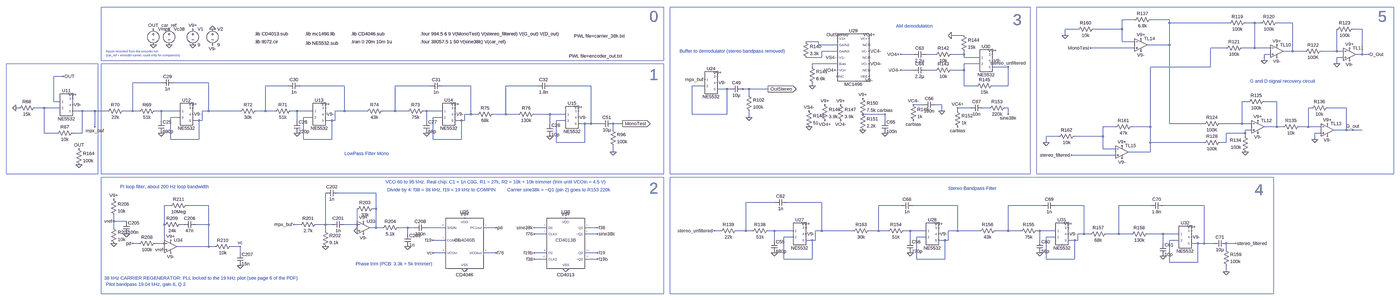
[diagram p0: schematic FM_Decoder.asc, whole sheet]
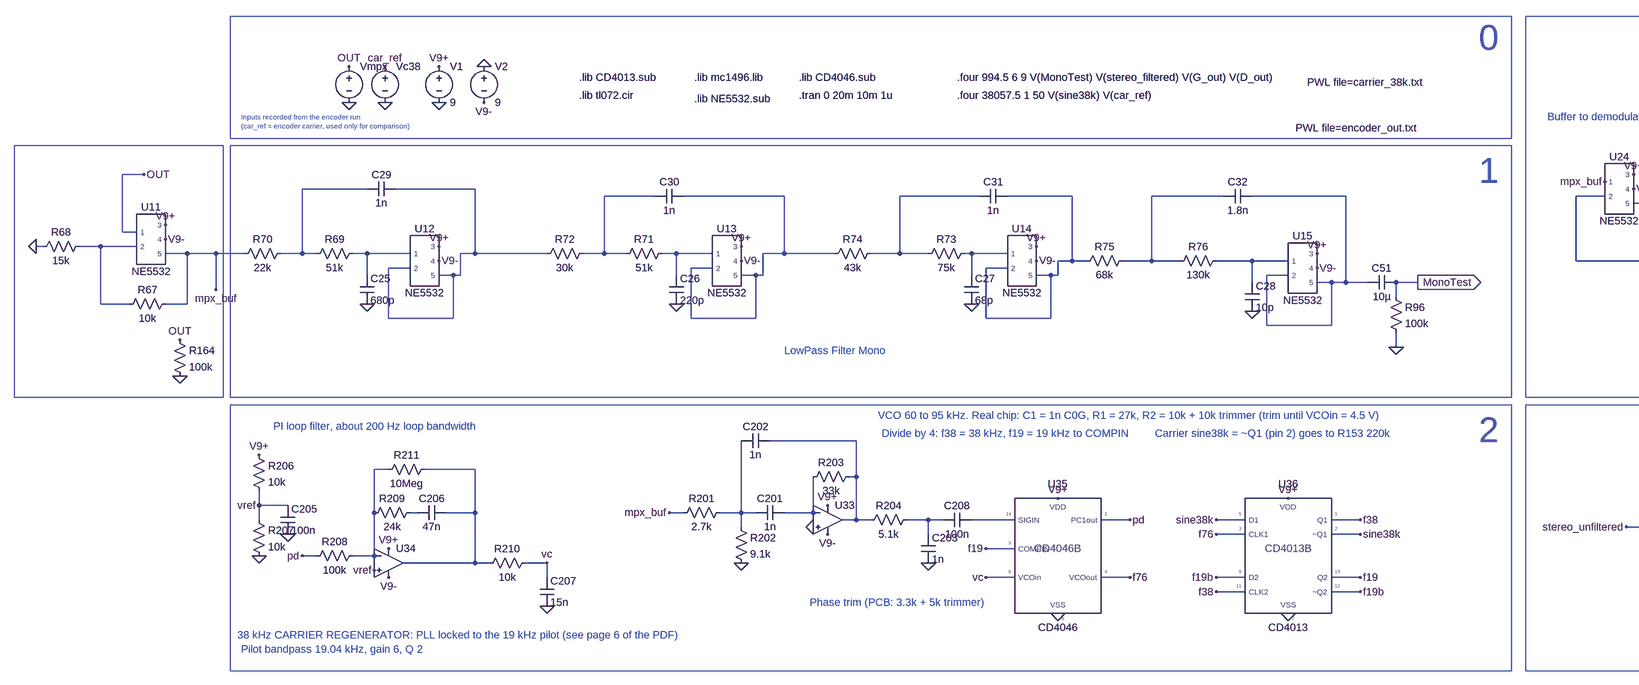
[diagram p1: schematic FM_Decoder.asc, part, row 1 of 1, column 1 of 2]
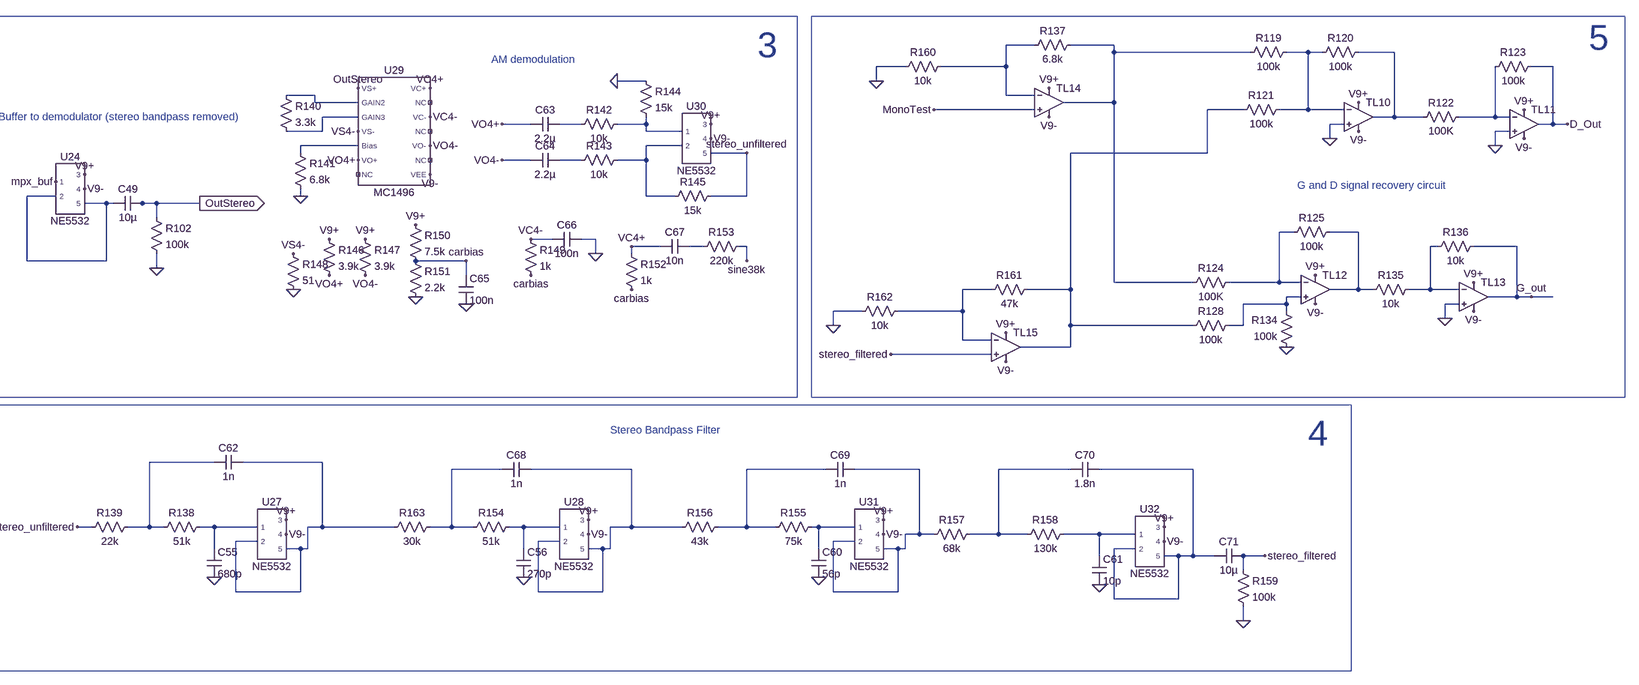
[diagram p2: schematic FM_Decoder.asc, part, row 1 of 1, column 2 of 2]
FM_Decoder.asc, the LTspice schematic file:
Version 4.1
SHEET 1 17428 680
WIRE 12016 -5552 11952 -5552
WIRE 12192 -5552 12096 -5552
WIRE 12192 -5536 12192 -5552
WIRE 12496 -5536 12192 -5536
WIRE 12624 -5536 12576 -5536
WIRE 12656 -5536 12624 -5536
WIRE 12816 -5536 12736 -5536
WIRE 11728 -5504 11664 -5504
WIRE 11952 -5504 11952 -5552
WIRE 11952 -5504 11808 -5504
WIRE 13168 -5504 13120 -5504
WIRE 11152 -5472 11088 -5472
WIRE 11664 -5472 11664 -5504
WIRE 10416 -5440 10352 -5440
WIRE 11952 -5440 11952 -5504
WIRE 12016 -5440 11952 -5440
WIRE 10416 -5424 10416 -5440
WIRE 10512 -5424 10416 -5424
WIRE 12192 -5424 12192 -5536
WIRE 12192 -5424 12080 -5424
WIRE 12016 -5408 11792 -5408
WIRE 12480 -5408 12400 -5408
WIRE 12624 -5408 12624 -5536
WIRE 12624 -5408 12560 -5408
WIRE 12704 -5408 12624 -5408
WIRE 10512 -5392 10432 -5392
WIRE 12816 -5392 12816 -5536
WIRE 12816 -5392 12768 -5392
WIRE 12880 -5392 12816 -5392
WIRE 13040 -5392 13040 -5504
WIRE 13040 -5392 12960 -5392
WIRE 13072 -5392 13040 -5392
WIRE 10896 -5376 10832 -5376
WIRE 11008 -5376 10960 -5376
WIRE 11152 -5376 11152 -5392
WIRE 11152 -5376 11088 -5376
WIRE 12704 -5376 12672 -5376
WIRE 13168 -5376 13168 -5504
WIRE 13168 -5376 13136 -5376
WIRE 13200 -5376 13168 -5376
WIRE 10432 -5360 10432 -5392
WIRE 10432 -5360 10352 -5360
WIRE 11152 -5360 11152 -5376
WIRE 11232 -5360 11152 -5360
WIRE 13072 -5360 13040 -5360
WIRE 12672 -5344 12672 -5376
WIRE 10512 -5328 10384 -5328
WIRE 11232 -5328 11152 -5328
WIRE 13040 -5328 13040 -5360
WIRE 10384 -5312 10384 -5328
WIRE 11376 -5312 11296 -5312
WIRE 12400 -5312 12400 -5408
WIRE 12400 -5312 12096 -5312
WIRE 10896 -5296 10832 -5296
WIRE 11008 -5296 10960 -5296
WIRE 11152 -5296 11152 -5328
WIRE 11152 -5296 11088 -5296
WIRE 6592 -5264 6544 -5264
WIRE 7088 -5232 6944 -5232
WIRE 7328 -5232 7152 -5232
WIRE 7728 -5216 7616 -5216
WIRE 8016 -5216 7792 -5216
WIRE 8448 -5216 8272 -5216
WIRE 8656 -5216 8512 -5216
WIRE 8992 -5216 8832 -5216
WIRE 9264 -5216 9056 -5216
WIRE 9840 -5216 9776 -5216
WIRE 10384 -5216 10384 -5232
WIRE 11152 -5216 11152 -5296
WIRE 11216 -5216 11152 -5216
WIRE 11376 -5216 11376 -5312
WIRE 11376 -5216 11296 -5216
WIRE 9952 -5200 9904 -5200
WIRE 9968 -5200 9952 -5200
WIRE 10032 -5200 10016 -5200
WIRE 10064 -5200 10032 -5200
WIRE 10160 -5200 10064 -5200
WIRE 10064 -5168 10064 -5200
WIRE 6544 -5136 6544 -5264
WIRE 6576 -5136 6544 -5136
WIRE 12592 -5136 12560 -5136
WIRE 12736 -5136 12672 -5136
WIRE 10944 -5120 10896 -5120
WIRE 11040 -5120 11008 -5120
WIRE 6368 -5104 6352 -5104
WIRE 6496 -5104 6448 -5104
WIRE 6576 -5104 6496 -5104
WIRE 11184 -5104 11120 -5104
WIRE 11280 -5104 11248 -5104
WIRE 11376 -5104 11360 -5104
WIRE 12912 -5104 12896 -5104
WIRE 13088 -5104 12992 -5104
WIRE 6688 -5088 6640 -5088
WIRE 6752 -5088 6688 -5088
WIRE 6816 -5088 6752 -5088
WIRE 6944 -5088 6944 -5232
WIRE 6944 -5088 6896 -5088
WIRE 6976 -5088 6944 -5088
WIRE 7088 -5088 7056 -5088
WIRE 7184 -5088 7088 -5088
WIRE 7328 -5088 7328 -5232
WIRE 7328 -5088 7296 -5088
WIRE 7488 -5088 7328 -5088
WIRE 7616 -5088 7616 -5216
WIRE 7616 -5088 7568 -5088
WIRE 7664 -5088 7616 -5088
WIRE 7776 -5088 7744 -5088
WIRE 7856 -5088 7776 -5088
WIRE 8016 -5088 8016 -5216
WIRE 8016 -5088 7968 -5088
WIRE 8128 -5088 8016 -5088
WIRE 8272 -5088 8272 -5216
WIRE 8272 -5088 8208 -5088
WIRE 8336 -5088 8272 -5088
WIRE 8432 -5088 8416 -5088
WIRE 8512 -5088 8432 -5088
WIRE 11040 -5088 11040 -5120
WIRE 11120 -5088 11120 -5104
WIRE 8656 -5072 8656 -5216
WIRE 8656 -5072 8624 -5072
WIRE 8688 -5072 8656 -5072
WIRE 8832 -5072 8832 -5216
WIRE 8832 -5072 8768 -5072
WIRE 8896 -5072 8832 -5072
WIRE 9056 -5072 8976 -5072
WIRE 9136 -5072 9056 -5072
WIRE 9776 -5072 9776 -5216
WIRE 9952 -5072 9952 -5200
WIRE 9952 -5072 9776 -5072
WIRE 10752 -5072 10640 -5072
WIRE 11376 -5072 11376 -5104
WIRE 7184 -5056 7136 -5056
WIRE 7856 -5056 7808 -5056
WIRE 8512 -5056 8464 -5056
WIRE 10064 -5056 10064 -5088
WIRE 7088 -5040 7088 -5088
WIRE 7280 -5040 7248 -5040
WIRE 7296 -5040 7296 -5088
WIRE 7296 -5040 7280 -5040
WIRE 7776 -5040 7776 -5088
WIRE 7952 -5040 7920 -5040
WIRE 7968 -5040 7968 -5088
WIRE 7968 -5040 7952 -5040
WIRE 8432 -5040 8432 -5088
WIRE 8608 -5040 8576 -5040
WIRE 8624 -5040 8624 -5072
WIRE 8624 -5040 8608 -5040
WIRE 9136 -5040 9088 -5040
WIRE 10752 -5040 10752 -5072
WIRE 9056 -5024 9056 -5072
WIRE 9232 -5024 9200 -5024
WIRE 9264 -5024 9264 -5216
WIRE 9264 -5024 9232 -5024
WIRE 9312 -5024 9264 -5024
WIRE 9424 -5024 9376 -5024
WIRE 12192 -5024 12192 -5424
WIRE 12368 -5024 12192 -5024
WIRE 12560 -5024 12560 -5136
WIRE 12560 -5024 12448 -5024
WIRE 12608 -5024 12560 -5024
WIRE 6752 -5008 6752 -5088
WIRE 11920 -5008 11856 -5008
WIRE 12096 -5008 12096 -5312
WIRE 12096 -5008 12000 -5008
WIRE 12736 -5008 12736 -5136
WIRE 12736 -5008 12672 -5008
WIRE 12768 -5008 12736 -5008
WIRE 12896 -5008 12896 -5104
WIRE 12896 -5008 12848 -5008
WIRE 12960 -5008 12896 -5008
WIRE 9376 -4992 9376 -5024
WIRE 12608 -4992 12576 -4992
WIRE 13088 -4992 13088 -5104
WIRE 13088 -4992 13024 -4992
WIRE 13120 -4992 13088 -4992
WIRE 13168 -4992 13120 -4992
WIRE 6496 -4976 6496 -5104
WIRE 6560 -4976 6496 -4976
WIRE 6688 -4976 6688 -5088
WIRE 6688 -4976 6640 -4976
WIRE 12576 -4976 12576 -4992
WIRE 12576 -4976 12480 -4976
WIRE 12960 -4976 12928 -4976
WIRE 11632 -4960 11568 -4960
WIRE 11856 -4960 11856 -5008
WIRE 11856 -4960 11712 -4960
WIRE 12576 -4960 12576 -4976
WIRE 7136 -4944 7136 -5056
WIRE 7280 -4944 7280 -5040
WIRE 7280 -4944 7136 -4944
WIRE 7808 -4944 7808 -5056
WIRE 7952 -4944 7952 -5040
WIRE 7952 -4944 7808 -4944
WIRE 8464 -4944 8464 -5056
WIRE 8608 -4944 8608 -5040
WIRE 8608 -4944 8464 -4944
WIRE 12928 -4944 12928 -4976
WIRE 9088 -4928 9088 -5040
WIRE 9232 -4928 9232 -5024
WIRE 9232 -4928 9088 -4928
WIRE 11568 -4928 11568 -4960
WIRE 12096 -4928 12096 -5008
WIRE 12368 -4928 12096 -4928
WIRE 12480 -4928 12480 -4976
WIRE 12480 -4928 12448 -4928
WIRE 11856 -4896 11856 -4960
WIRE 11920 -4896 11856 -4896
WIRE 9376 -4880 9376 -4912
WIRE 12096 -4880 12096 -4928
WIRE 12096 -4880 11984 -4880
WIRE 11920 -4864 11696 -4864
WIRE 8176 -4672 7984 -4672
WIRE 10192 -4624 10048 -4624
WIRE 10432 -4624 10256 -4624
WIRE 7136 -4608 7104 -4608
WIRE 7328 -4608 7216 -4608
WIRE 10832 -4608 10720 -4608
WIRE 11120 -4608 10896 -4608
WIRE 11552 -4608 11376 -4608
WIRE 11760 -4608 11616 -4608
WIRE 12096 -4608 11936 -4608
WIRE 12368 -4608 12160 -4608
WIRE 8176 -4592 8176 -4672
WIRE 8176 -4592 8160 -4592
WIRE 6848 -4528 6848 -4560
WIRE 6912 -4528 6848 -4528
WIRE 7104 -4512 7104 -4608
WIRE 7200 -4512 7184 -4512
WIRE 7328 -4512 7328 -4608
WIRE 7328 -4512 7264 -4512
WIRE 7792 -4512 7760 -4512
WIRE 7920 -4512 7920 -4672
WIRE 7920 -4512 7872 -4512
WIRE 7952 -4512 7920 -4512
WIRE 8080 -4512 8080 -4592
WIRE 8080 -4512 8016 -4512
WIRE 6848 -4496 6848 -4528
WIRE 8176 -4496 8176 -4592
WIRE 8176 -4496 8144 -4496
WIRE 8208 -4496 8176 -4496
WIRE 8336 -4496 8288 -4496
WIRE 8368 -4496 8336 -4496
WIRE 8528 -4496 8432 -4496
WIRE 8784 -4496 8720 -4496
WIRE 9040 -4496 8976 -4496
WIRE 9296 -4496 9232 -4496
WIRE 7920 -4480 7920 -4512
WIRE 9920 -4480 9888 -4480
WIRE 10048 -4480 10048 -4624
WIRE 10048 -4480 10000 -4480
WIRE 10080 -4480 10048 -4480
WIRE 10192 -4480 10160 -4480
WIRE 10288 -4480 10192 -4480
WIRE 10432 -4480 10432 -4624
WIRE 10432 -4480 10400 -4480
WIRE 10592 -4480 10432 -4480
WIRE 10720 -4480 10720 -4608
WIRE 10720 -4480 10672 -4480
WIRE 10768 -4480 10720 -4480
WIRE 10880 -4480 10848 -4480
WIRE 10960 -4480 10880 -4480
WIRE 11120 -4480 11120 -4608
WIRE 11120 -4480 11072 -4480
WIRE 11232 -4480 11120 -4480
WIRE 11376 -4480 11376 -4608
WIRE 11376 -4480 11312 -4480
WIRE 11440 -4480 11376 -4480
WIRE 11536 -4480 11520 -4480
WIRE 11616 -4480 11536 -4480
WIRE 8336 -4464 8336 -4496
WIRE 9040 -4464 8976 -4464
WIRE 9296 -4464 9232 -4464
WIRE 11760 -4464 11760 -4608
WIRE 11760 -4464 11728 -4464
WIRE 11792 -4464 11760 -4464
WIRE 11936 -4464 11936 -4608
WIRE 11936 -4464 11872 -4464
WIRE 12000 -4464 11936 -4464
WIRE 12160 -4464 12080 -4464
WIRE 12240 -4464 12160 -4464
WIRE 10288 -4448 10240 -4448
WIRE 10960 -4448 10912 -4448
WIRE 11616 -4448 11568 -4448
WIRE 8528 -4432 8464 -4432
WIRE 10192 -4432 10192 -4480
WIRE 10384 -4432 10352 -4432
WIRE 10400 -4432 10400 -4480
WIRE 10400 -4432 10384 -4432
WIRE 10880 -4432 10880 -4480
WIRE 11056 -4432 11024 -4432
WIRE 11072 -4432 11072 -4480
WIRE 11072 -4432 11056 -4432
WIRE 11536 -4432 11536 -4480
WIRE 11712 -4432 11680 -4432
WIRE 11728 -4432 11728 -4464
WIRE 11728 -4432 11712 -4432
WIRE 12240 -4432 12192 -4432
WIRE 6976 -4416 6944 -4416
WIRE 7104 -4416 7104 -4512
WIRE 7104 -4416 7056 -4416
WIRE 12160 -4416 12160 -4464
WIRE 12336 -4416 12304 -4416
WIRE 12368 -4416 12368 -4608
WIRE 12368 -4416 12336 -4416
WIRE 12416 -4416 12368 -4416
WIRE 12528 -4416 12480 -4416
WIRE 7328 -4400 7328 -4512
WIRE 7328 -4400 7168 -4400
WIRE 7360 -4400 7328 -4400
WIRE 7488 -4400 7440 -4400
WIRE 12480 -4384 12480 -4416
WIRE 7488 -4368 7488 -4400
WIRE 8528 -4368 8464 -4368
WIRE 8784 -4368 8720 -4368
WIRE 9040 -4368 8976 -4368
WIRE 9296 -4368 9232 -4368
WIRE 9040 -4336 8976 -4336
WIRE 9296 -4336 9232 -4336
WIRE 10240 -4336 10240 -4448
WIRE 10384 -4336 10384 -4432
WIRE 10384 -4336 10240 -4336
WIRE 10912 -4336 10912 -4448
WIRE 11056 -4336 11056 -4432
WIRE 11056 -4336 10912 -4336
WIRE 11568 -4336 11568 -4448
WIRE 11712 -4336 11712 -4432
WIRE 11712 -4336 11568 -4336
WIRE 12192 -4320 12192 -4432
WIRE 12336 -4320 12336 -4416
WIRE 12336 -4320 12192 -4320
WIRE 12480 -4272 12480 -4304
FLAG 6672 -4896 OUT
FLAG 6672 -4816 0
FLAG 6592 -5264 OUT
FLAG 7048 -5504 OUT
FLAG 7048 -5424 0
FLAG 7128 -5504 car_ref
FLAG 7128 -5424 0
FLAG 7248 -5504 V9+
FLAG 7248 -5424 0
FLAG 7348 -5504 0
FLAG 7348 -5424 V9-
FLAG 6640 -5152 V9+
FLAG 6640 -5120 V9-
FLAG 6352 -5104 0
FLAG 7088 -4976 0
FLAG 7776 -4976 0
FLAG 8432 -4976 0
FLAG 9056 -4960 0
FLAG 7248 -5104 V9+
FLAG 7248 -5072 V9-
FLAG 7920 -5104 V9+
FLAG 8576 -5104 V9+
FLAG 9200 -5088 V9+
FLAG 7920 -5072 V9-
FLAG 8576 -5072 V9-
FLAG 9200 -5056 V9-
FLAG 9376 -4880 0
FLAG 9424 -5024 MonoTest
IOPIN 9424 -5024 Out
FLAG 9904 -5264 V9+
FLAG 9840 -5248 mpx_buf
FLAG 6752 -5008 mpx_buf
FLAG 9904 -5232 V9-
FLAG 10064 -5056 0
FLAG 10160 -5200 OutStereo
IOPIN 10160 -5200 Out
FLAG 10672 -5264 V9-
FLAG 10512 -5296 VO4+
FLAG 10672 -5328 VO4-
FLAG 10512 -5360 VS4-
FLAG 10672 -5392 VC4-
FLAG 10512 -5456 OutStereo
FLAG 10384 -5216 0
FLAG 10672 -5456 VC4+
FLAG 10832 -5296 VO4-
FLAG 10832 -5376 VO4+
FLAG 11296 -5376 V9+
FLAG 11296 -5344 V9-
FLAG 11376 -5312 stereo_unfiltered
FLAG 11088 -5472 0
FLAG 10528 -5040 VO4-
FLAG 10448 -5040 VO4+
FLAG 10448 -5120 V9+
FLAG 10528 -5120 V9+
FLAG 10368 -5008 0
FLAG 10368 -5088 VS4-
FLAG 10896 -5120 VC4-
FLAG 10896 -5040 carbias
FLAG 10640 -4992 0
FLAG 10752 -4976 0
FLAG 10640 -5152 V9+
FLAG 11040 -5088 0
FLAG 11120 -5104 VC4+
FLAG 11120 -5008 carbias
FLAG 11376 -5072 sine38k
FLAG 10752 -5072 carbias
FLAG 12736 -5424 V9+
FLAG 12736 -5360 V9-
FLAG 12672 -5344 0
FLAG 13104 -5408 V9+
FLAG 13104 -5344 V9-
FLAG 13040 -5328 0
FLAG 13200 -5376 D_Out
FLAG 10192 -4368 0
FLAG 10880 -4368 0
FLAG 11536 -4368 0
FLAG 12160 -4352 0
FLAG 10352 -4496 V9+
FLAG 10352 -4464 V9-
FLAG 11024 -4496 V9+
FLAG 11680 -4496 V9+
FLAG 12304 -4480 V9+
FLAG 11024 -4464 V9-
FLAG 11680 -4464 V9-
FLAG 12304 -4448 V9-
FLAG 12480 -4272 0
FLAG 9888 -4480 stereo_unfiltered
FLAG 12528 -4416 stereo_filtered
FLAG 12640 -5040 V9+
FLAG 12640 -4976 V9-
FLAG 12576 -4880 0
FLAG 12992 -5024 V9+
FLAG 12992 -4960 V9-
FLAG 12928 -4944 0
FLAG 13120 -4992 G_out
FLAG 12048 -5456 V9+
FLAG 12048 -5392 V9-
FLAG 11792 -5408 MonoTest
FLAG 11664 -5472 0
FLAG 11952 -4912 V9+
FLAG 11952 -4848 V9-
FLAG 11696 -4864 stereo_filtered
FLAG 11568 -4928 0
FLAG 7760 -4512 mpx_buf
FLAG 7920 -4400 0
FLAG 8112 -4528 V9+
FLAG 8112 -4464 V9-
FLAG 8080 -4480 0
FLAG 8336 -4400 0
FLAG 8624 -4544 V9+
FLAG 8624 -4288 0
FLAG 8464 -4432 f19
FLAG 8464 -4368 vc
FLAG 8784 -4496 pd
FLAG 8784 -4368 f76
FLAG 9136 -4544 V9+
FLAG 9136 -4288 0
FLAG 8976 -4464 f76
FLAG 8976 -4496 sine38k
FLAG 9296 -4496 f38
FLAG 9296 -4464 sine38k
FLAG 8976 -4336 f38
FLAG 8976 -4368 f19b
FLAG 9296 -4368 f19
FLAG 9296 -4336 f19b
FLAG 6944 -4416 pd
FLAG 7136 -4432 V9+
FLAG 7136 -4368 V9-
FLAG 7104 -4384 vref
FLAG 7488 -4400 vc
FLAG 7488 -4304 0
FLAG 6848 -4640 V9+
FLAG 6848 -4528 vref
FLAG 6848 -4416 0
FLAG 6912 -4464 0
SYMBOL voltage 7048 -5520 R0
WINDOW 123 0 0 Left 0
WINDOW 39 0 0 Left 0
WINDOW 3 2104 153 Left 2
SYMATTR Value PWL file=encoder_out.txt
SYMATTR InstName Vmpx
SYMBOL voltage 7128 -5520 R0
WINDOW 123 0 0 Left 0
WINDOW 39 0 0 Left 0
WINDOW 3 2050 51 Left 2
SYMATTR Value PWL file=carrier_38k.txt
SYMATTR InstName Vc38
SYMBOL voltage 7248 -5520 R0
WINDOW 123 0 0 Left 0
WINDOW 39 0 0 Left 0
SYMATTR InstName V1
SYMATTR Value 9
SYMBOL voltage 7348 -5520 R0
WINDOW 123 0 0 Left 0
WINDOW 39 0 0 Left 0
SYMATTR InstName V2
SYMATTR Value 9
SYMBOL NE5532 6608 -5120 R0
SYMATTR InstName U11
SYMBOL res 6656 -4992 R90
WINDOW 0 0 56 VBottom 2
WINDOW 3 32 56 VTop 2
SYMATTR InstName R67
SYMATTR Value 10k
SYMBOL res 6464 -5120 R90
WINDOW 0 0 56 VBottom 2
WINDOW 3 32 56 VTop 2
SYMATTR InstName R68
SYMATTR Value 15k
SYMBOL NE5532 7216 -5072 R0
SYMATTR InstName U12
SYMBOL NE5532 7888 -5072 R0
SYMATTR InstName U13
SYMBOL NE5532 8544 -5072 R0
SYMATTR InstName U14
SYMBOL NE5532 9168 -5056 R0
SYMATTR InstName U15
SYMBOL res 7072 -5104 R90
WINDOW 0 0 56 VBottom 2
WINDOW 3 32 56 VTop 2
SYMATTR InstName R69
SYMATTR Value 51k
SYMBOL res 6912 -5104 R90
WINDOW 0 0 56 VBottom 2
WINDOW 3 32 56 VTop 2
SYMATTR InstName R70
SYMATTR Value 22k
SYMBOL res 7760 -5104 R90
WINDOW 0 0 56 VBottom 2
WINDOW 3 32 56 VTop 2
SYMATTR InstName R71
SYMATTR Value 51k
SYMBOL res 7584 -5104 R90
WINDOW 0 0 56 VBottom 2
WINDOW 3 32 56 VTop 2
SYMATTR InstName R72
SYMATTR Value 30k
SYMBOL res 8432 -5104 R90
WINDOW 0 0 56 VBottom 2
WINDOW 3 32 56 VTop 2
SYMATTR InstName R73
SYMATTR Value 75k
SYMBOL res 8224 -5104 R90
WINDOW 0 0 56 VBottom 2
WINDOW 3 32 56 VTop 2
SYMATTR InstName R74
SYMATTR Value 43k
SYMBOL res 8784 -5088 R90
WINDOW 0 0 56 VBottom 2
WINDOW 3 32 56 VTop 2
SYMATTR InstName R75
SYMATTR Value 68k
SYMBOL res 8992 -5088 R90
WINDOW 0 0 56 VBottom 2
WINDOW 3 32 56 VTop 2
SYMATTR InstName R76
SYMATTR Value 130k
SYMBOL cap 7072 -5040 R0
SYMATTR InstName C25
SYMATTR Value 680p
SYMBOL cap 7760 -5040 R0
SYMATTR InstName C26
SYMATTR Value 220p
SYMBOL cap 8416 -5040 R0
SYMATTR InstName C27
SYMATTR Value 68p
SYMBOL cap 9040 -5024 R0
SYMATTR InstName C28
SYMATTR Value 10p
SYMBOL cap 7152 -5248 R90
WINDOW 0 0 32 VBottom 2
WINDOW 3 32 32 VTop 2
SYMATTR InstName C29
SYMATTR Value 1n
SYMBOL cap 7792 -5232 R90
WINDOW 0 0 32 VBottom 2
WINDOW 3 32 32 VTop 2
SYMATTR InstName C30
SYMATTR Value 1n
SYMBOL cap 8512 -5232 R90
WINDOW 0 0 32 VBottom 2
WINDOW 3 32 32 VTop 2
SYMATTR InstName C31
SYMATTR Value 1n
SYMBOL cap 9056 -5232 R90
WINDOW 0 0 32 VBottom 2
WINDOW 3 32 32 VTop 2
SYMATTR InstName C32
SYMATTR Value 1.8n
SYMBOL cap 9376 -5040 R90
WINDOW 0 0 32 VBottom 2
WINDOW 3 32 32 VTop 2
SYMATTR InstName C51
SYMATTR Value 10µ
SYMBOL res 9360 -5008 R0
SYMATTR InstName R96
SYMATTR Value 100k
SYMBOL NE5532 9872 -5232 R0
SYMATTR InstName U24
SYMBOL res 10048 -5184 R0
SYMATTR InstName R102
SYMATTR Value 100k
SYMBOL cap 10032 -5216 R90
WINDOW 0 0 32 VBottom 2
WINDOW 3 32 32 VTop 2
SYMATTR InstName C49
SYMATTR Value 10µ
SYMBOL MC1496 10592 -5360 R0
SYMATTR InstName U29
SYMBOL res 10336 -5456 R0
SYMATTR InstName R140
SYMATTR Value 3.3k
SYMBOL res 10368 -5328 R0
SYMATTR InstName R141
SYMATTR Value 6.8k
SYMBOL cap 10960 -5392 R90
WINDOW 0 0 32 VBottom 2
WINDOW 3 32 32 VTop 2
SYMATTR InstName C63
SYMATTR Value 2.2µ
SYMBOL cap 10960 -5312 R90
WINDOW 0 0 32 VBottom 2
WINDOW 3 32 32 VTop 2
SYMATTR InstName C64
SYMATTR Value 2.2µ
SYMBOL res 11104 -5392 R90
WINDOW 0 0 56 VBottom 2
WINDOW 3 32 56 VTop 2
SYMATTR InstName R142
SYMATTR Value 10k
SYMBOL res 11104 -5312 R90
WINDOW 0 0 56 VBottom 2
WINDOW 3 32 56 VTop 2
SYMATTR InstName R143
SYMATTR Value 10k
SYMBOL res 11136 -5488 R0
SYMATTR InstName R144
SYMATTR Value 15k
SYMBOL res 11312 -5232 R90
WINDOW 0 0 56 VBottom 2
WINDOW 3 32 56 VTop 2
SYMATTR InstName R145
SYMATTR Value 15k
SYMBOL NE5532 11264 -5344 R0
SYMATTR InstName U30
SYMBOL res 10432 -5136 R0
SYMATTR InstName R146
SYMATTR Value 3.9k
SYMBOL res 10512 -5136 R0
SYMATTR InstName R147
SYMATTR Value 3.9k
SYMBOL res 10352 -5104 R0
SYMATTR InstName R148
SYMATTR Value 51
SYMBOL res 10880 -5136 R0
SYMATTR InstName R149
SYMATTR Value 1k
SYMBOL res 10624 -5168 R0
SYMATTR InstName R150
SYMATTR Value 7.5k
SYMBOL res 10624 -5088 R0
SYMATTR InstName R151
SYMATTR Value 2.2k
SYMBOL cap 10736 -5040 R0
SYMATTR InstName C65
SYMATTR Value 100n
SYMBOL cap 11008 -5136 R90
WINDOW 0 0 32 VBottom 2
WINDOW 3 32 32 VTop 2
SYMATTR InstName C66
SYMATTR Value 100n
SYMBOL res 11104 -5104 R0
SYMATTR InstName R152
SYMATTR Value 1k
SYMBOL cap 11248 -5120 R90
WINDOW 0 0 32 VBottom 2
WINDOW 3 32 32 VTop 2
SYMATTR InstName C67
SYMATTR Value 10n
SYMBOL res 11376 -5120 R90
WINDOW 0 0 56 VBottom 2
WINDOW 3 32 56 VTop 2
SYMATTR InstName R153
SYMATTR Value 220k
SYMBOL res 12592 -5552 R90
WINDOW 0 0 56 VBottom 2
WINDOW 3 32 56 VTop 2
SYMATTR InstName R119
SYMATTR Value 100k
SYMBOL res 12752 -5552 R90
WINDOW 0 0 56 VBottom 2
WINDOW 3 32 56 VTop 2
SYMATTR InstName R120
SYMATTR Value 100k
SYMBOL res 12576 -5424 R90
WINDOW 0 0 56 VBottom 2
WINDOW 3 32 56 VTop 2
SYMATTR InstName R121
SYMATTR Value 100k
SYMBOL OpAmps\\opamp2 12736 -5456 R0
SYMATTR InstName TL10
SYMATTR Value ""
SYMATTR SpiceModel TL072
SYMBOL res 12976 -5408 R90
WINDOW 0 0 56 VBottom 2
WINDOW 3 32 56 VTop 2
SYMATTR InstName R122
SYMATTR Value 100K
SYMBOL res 13136 -5520 R90
WINDOW 0 0 56 VBottom 2
WINDOW 3 32 56 VTop 2
SYMATTR InstName R123
SYMATTR Value 100k
SYMBOL OpAmps\\opamp2 13104 -5440 R0
SYMATTR InstName TL11
SYMATTR Value ""
SYMATTR SpiceModel TL072
SYMBOL NE5532 10320 -4464 R0
SYMATTR InstName U27
SYMBOL NE5532 10992 -4464 R0
SYMATTR InstName U28
SYMBOL NE5532 11648 -4464 R0
SYMATTR InstName U31
SYMBOL NE5532 12272 -4448 R0
SYMATTR InstName U32
SYMBOL res 10176 -4496 R90
WINDOW 0 0 56 VBottom 2
WINDOW 3 32 56 VTop 2
SYMATTR InstName R138
SYMATTR Value 51k
SYMBOL res 10016 -4496 R90
WINDOW 0 0 56 VBottom 2
WINDOW 3 32 56 VTop 2
SYMATTR InstName R139
SYMATTR Value 22k
SYMBOL res 10864 -4496 R90
WINDOW 0 0 56 VBottom 2
WINDOW 3 32 56 VTop 2
SYMATTR InstName R154
SYMATTR Value 51k
SYMBOL res 10688 -4496 R90
WINDOW 0 0 56 VBottom 2
WINDOW 3 32 56 VTop 2
SYMATTR InstName R163
SYMATTR Value 30k
SYMBOL res 11536 -4496 R90
WINDOW 0 0 56 VBottom 2
WINDOW 3 32 56 VTop 2
SYMATTR InstName R155
SYMATTR Value 75k
SYMBOL res 11328 -4496 R90
WINDOW 0 0 56 VBottom 2
WINDOW 3 32 56 VTop 2
SYMATTR InstName R156
SYMATTR Value 43k
SYMBOL res 11888 -4480 R90
WINDOW 0 0 56 VBottom 2
WINDOW 3 32 56 VTop 2
SYMATTR InstName R157
SYMATTR Value 68k
SYMBOL res 12096 -4480 R90
WINDOW 0 0 56 VBottom 2
WINDOW 3 32 56 VTop 2
SYMATTR InstName R158
SYMATTR Value 130k
SYMBOL cap 10176 -4432 R0
SYMATTR InstName C55
SYMATTR Value 680p
SYMBOL cap 10864 -4432 R0
SYMATTR InstName C56
SYMATTR Value 270p
SYMBOL cap 11520 -4432 R0
SYMATTR InstName C60
SYMATTR Value 56p
SYMBOL cap 12144 -4416 R0
SYMATTR InstName C61
SYMATTR Value 10p
SYMBOL cap 10256 -4640 R90
WINDOW 0 0 32 VBottom 2
WINDOW 3 32 32 VTop 2
SYMATTR InstName C62
SYMATTR Value 1n
SYMBOL cap 10896 -4624 R90
WINDOW 0 0 32 VBottom 2
WINDOW 3 32 32 VTop 2
SYMATTR InstName C68
SYMATTR Value 1n
SYMBOL cap 11616 -4624 R90
WINDOW 0 0 32 VBottom 2
WINDOW 3 32 32 VTop 2
SYMATTR InstName C69
SYMATTR Value 1n
SYMBOL cap 12160 -4624 R90
WINDOW 0 0 32 VBottom 2
WINDOW 3 32 32 VTop 2
SYMATTR InstName C70
SYMATTR Value 1.8n
SYMBOL cap 12480 -4432 R90
WINDOW 0 0 32 VBottom 2
WINDOW 3 32 32 VTop 2
SYMATTR InstName C71
SYMATTR Value 10µ
SYMBOL res 12464 -4400 R0
SYMATTR InstName R159
SYMATTR Value 100k
SYMBOL res 12464 -5040 R90
WINDOW 0 0 56 VBottom 2
WINDOW 3 32 56 VTop 2
SYMATTR InstName R124
SYMATTR Value 100K
SYMBOL res 12688 -5152 R90
WINDOW 0 0 56 VBottom 2
WINDOW 3 32 56 VTop 2
SYMATTR InstName R125
SYMATTR Value 100k
SYMBOL res 12464 -4944 R90
WINDOW 0 0 56 VBottom 2
WINDOW 3 32 56 VTop 2
SYMATTR InstName R128
SYMATTR Value 100k
SYMBOL res 12592 -4864 R180
WINDOW 0 36 76 Left 2
WINDOW 3 36 40 Left 2
SYMATTR InstName R134
SYMATTR Value 100k
SYMBOL OpAmps\\opamp2 12640 -5072 R0
SYMATTR InstName TL12
SYMATTR Value ""
SYMATTR SpiceModel TL072
SYMBOL res 12864 -5024 R90
WINDOW 0 0 56 VBottom 2
WINDOW 3 32 56 VTop 2
SYMATTR InstName R135
SYMATTR Value 10k
SYMBOL res 13008 -5120 R90
WINDOW 0 0 56 VBottom 2
WINDOW 3 32 56 VTop 2
SYMATTR InstName R136
SYMATTR Value 10k
SYMBOL OpAmps\\opamp2 12992 -5056 R0
SYMATTR InstName TL13
SYMATTR Value ""
SYMATTR SpiceModel TL072
SYMBOL OpAmps\\opamp2 12048 -5488 R0
SYMATTR InstName TL14
SYMATTR Value ""
SYMATTR SpiceModel TL072
SYMBOL res 12112 -5568 R90
WINDOW 0 0 56 VBottom 2
WINDOW 3 32 56 VTop 2
SYMATTR InstName R137
SYMATTR Value 6.8k
SYMBOL res 11824 -5520 R90
WINDOW 0 0 56 VBottom 2
WINDOW 3 32 56 VTop 2
SYMATTR InstName R160
SYMATTR Value 10k
SYMBOL OpAmps\\opamp2 11952 -4944 R0
SYMATTR InstName TL15
SYMATTR Value ""
SYMATTR SpiceModel TL072
SYMBOL res 12016 -5024 R90
WINDOW 0 0 56 VBottom 2
WINDOW 3 32 56 VTop 2
SYMATTR InstName R161
SYMATTR Value 47k
SYMBOL res 11728 -4976 R90
WINDOW 0 0 56 VBottom 2
WINDOW 3 32 56 VTop 2
SYMATTR InstName R162
SYMATTR Value 10k
SYMBOL res 7888 -4528 R90
WINDOW 0 0 56 VBottom 2
WINDOW 3 32 56 VTop 2
SYMATTR InstName R201
SYMATTR Value 2.7k
SYMBOL res 7904 -4496 R0
SYMATTR InstName R202
SYMATTR Value 9.1k
SYMBOL cap 8016 -4528 R90
WINDOW 0 0 32 VBottom 2
WINDOW 3 32 32 VTop 2
SYMATTR InstName C201
SYMATTR Value 1n
SYMBOL OpAmps\\opamp2 8112 -4560 R0
SYMATTR InstName U33
SYMATTR Value ""
SYMATTR SpiceModel TL072
SYMBOL res 8176 -4608 R90
WINDOW 0 0 56 VBottom 2
WINDOW 3 32 56 VTop 2
SYMATTR InstName R203
SYMATTR Value 33k
SYMBOL cap 7984 -4688 R90
WINDOW 0 0 32 VBottom 2
WINDOW 3 32 32 VTop 2
SYMATTR InstName C202
SYMATTR Value 1n
SYMBOL res 8304 -4512 R90
WINDOW 0 0 56 VBottom 2
WINDOW 3 32 56 VTop 2
SYMATTR InstName R204
SYMATTR Value 5.1k
SYMBOL cap 8320 -4464 R0
SYMATTR InstName C203
SYMATTR Value 1n
SYMBOL cap 8432 -4512 R90
WINDOW 0 0 32 VBottom 2
WINDOW 3 32 32 VTop 2
SYMATTR InstName C208
SYMATTR Value 100n
SYMBOL CD4046 8624 -4416 R0
SYMATTR InstName U35
SYMATTR SpiceLine fmin=60k fmax=95k
SYMBOL CD4013 9136 -4416 R0
SYMATTR InstName U36
SYMBOL res 7072 -4432 R90
WINDOW 0 0 56 VBottom 2
WINDOW 3 32 56 VTop 2
SYMATTR InstName R208
SYMATTR Value 100k
SYMBOL OpAmps\\opamp2 7136 -4464 R0
SYMATTR InstName U34
SYMATTR Value ""
SYMATTR SpiceModel TL072
SYMBOL res 7200 -4528 R90
WINDOW 0 0 56 VBottom 2
WINDOW 3 32 56 VTop 2
SYMATTR InstName R209
SYMATTR Value 24k
SYMBOL cap 7264 -4528 R90
WINDOW 0 0 32 VBottom 2
WINDOW 3 32 32 VTop 2
SYMATTR InstName C206
SYMATTR Value 47n
SYMBOL res 7232 -4624 R90
WINDOW 0 0 56 VBottom 2
WINDOW 3 32 56 VTop 2
SYMATTR InstName R211
SYMATTR Value 10Meg
SYMBOL res 7456 -4416 R90
WINDOW 0 0 56 VBottom 2
WINDOW 3 32 56 VTop 2
SYMATTR InstName R210
SYMATTR Value 10k
SYMBOL cap 7472 -4368 R0
SYMATTR InstName C207
SYMATTR Value 15n
SYMBOL res 6832 -4656 R0
SYMATTR InstName R206
SYMATTR Value 10k
SYMBOL res 6832 -4512 R0
SYMATTR InstName R207
SYMATTR Value 10k
SYMBOL cap 6896 -4528 R0
SYMATTR InstName C205
SYMATTR Value 100n
SYMBOL res 6656 -4912 R0
SYMATTR InstName R164
SYMATTR Value 100k
TEXT 9712 -5392 Left 2 ;Buffer to demodulator (stereo bandpass removed)
TEXT 8016 -4872 Left 2 ;LowPass Filter Mono
TEXT 10808 -5520 Left 2 ;AM demodulation
TEXT 12600 -5240 Left 2 ;G and D signal recovery circuit
TEXT 6808 -5392 Left 1 ;Inputs recorded from the encoder run \n(car_ref = encoder carrier, used only for comparison)
TEXT 8048 -5440 Left 2 !.tran 0 20m 10m 1u
TEXT 8400 -5440 Left 2 !.four 38057.5 1 50 V(sine38k) V(car_ref)
TEXT 7560 -5440 Left 2 !.lib tl072.cir
TEXT 7816 -5480 Left 2 !.lib mc1496.lib
TEXT 7816 -5432 Left 2 !.lib NE5532.sub
TEXT 8400 -5480 Left 2 !.four 994.5 6 9 V(MonoTest) V(stereo_filtered) V(G_out) V(D_out)
TEXT 6800 -4240 Left 2 ;38 kHz CARRIER REGENERATOR: PLL locked to the 19 kHz pilot (see page 6 of the PDF)
TEXT 6808 -4208 Left 2 ;Pilot bandpass 19.04 kHz, gain 6, Q 2
TEXT 8072 -4312 Left 2 ;Phase trim (PCB: 3.3k + 5k trimmer)
TEXT 8224 -4728 Left 2 ;VCO 60 to 95 kHz. Real chip: C1 = 1n C0G, R1 = 27k, R2 = 10k + 10k trimmer (trim until VCOin = 4.5 V)
TEXT 8232 -4688 Left 2 ;Divide by 4: f38 = 38 kHz, f19 = 19 kHz to COMPIN
TEXT 8840 -4688 Left 2 ;Carrier sine38k = ~Q1 (pin 2) goes to R153 220k
TEXT 6880 -4704 Left 2 ;PI loop filter, about 200 Hz loop bandwidth
TEXT 8048 -5480 Left 2 !.lib CD4046.sub
TEXT 7560 -5480 Left 2 !.lib CD4013.sub
TEXT 9560 -5568 Left 6 ;0
TEXT 9560 -5272 Left 6 ;1
TEXT 9560 -4696 Left 6 ;2
TEXT 11400 -5552 Left 6 ;3
TEXT 11072 -4696 Left 2 ;Stereo Bandpass Filter
TEXT 12624 -4688 Left 6 ;4
TEXT 13248 -5568 Left 6 ;5
RECTANGLE Normal 9632 -4768 6784 -5328
RECTANGLE Normal 9632 -5616 6784 -5344
RECTANGLE Normal 9632 -4160 6784 -4752
RECTANGLE Normal 11488 -4768 9664 -5616
RECTANGLE Normal 12720 -4160 9664 -4752
RECTANGLE Normal 13328 -4768 11520 -5616
RECTANGLE Normal 6304 -4768 6768 -5328

The netlist it stands for:
* FM_Decoder.asc
Vmpx OUT 0 PWL file=encoder_out.txt
Vc38 car_ref 0 PWL file=carrier_38k.txt
V1 V9+ 0 9
V2 0 V9- 9
X§U11 OUT N025 V9+ V9- mpx_buf NE5532  ; pins 1 2 3 4 5
R67 mpx_buf N025 10k
R68 N025 0 15k
X§U12 N028 N015 V9+ V9- N015 NE5532  ; pins 1 2 3 4 5
X§U13 N029 N017 V9+ V9- N017 NE5532  ; pins 1 2 3 4 5
X§U14 N030 N019 V9+ V9- N019 NE5532  ; pins 1 2 3 4 5
X§U15 N031 N021 V9+ V9- N021 NE5532  ; pins 1 2 3 4 5
R69 N028 N014 51k
R70 N014 mpx_buf 22k
R71 N029 N016 51k
R72 N016 N015 30k
R73 N030 N018 75k
R74 N018 N017 43k
R75 N020 N019 68k
R76 N031 N020 130k
C25 N028 0 680p
C26 N029 0 220p
C27 N030 0 68p
C28 N031 0 10p
C29 N015 N014 1n
C30 N017 N016 1n
C31 N019 N018 1n
C32 N021 N020 1.8n
C51 MonoTest N021 10µ
R96 MonoTest 0 100k
X§U24 mpx_buf N022 V9+ V9- N022 NE5532  ; pins 1 2 3 4 5
R102 OutStereo 0 100k
C49 OutStereo N022 10µ
X§U29 OutStereo N005 N007 VS4- N011 VO4+ NC_01 VC4+ NC_02 VC4- NC_03 VO4- NC_04 V9- MC1496  ; pins VS+ GAIN2 GAIN3 VS- Bias VO+ NC VC+ NC VC- NC VO- NC VEE
R140 N005 N007 3.3k
R141 N011 0 6.8k
C63 N009 VO4+ 2.2µ
C64 N013 VO4- 2.2µ
R142 N010 N009 10k
R143 N012 N013 10k
R144 0 N010 15k
R145 stereo_unfiltered N012 15k
X§U30 N010 N012 V9+ V9- stereo_unfiltered NE5532  ; pins 1 2 3 4 5
R146 V9+ VO4+ 3.9k
R147 V9+ VO4- 3.9k
R148 VS4- 0 51
R149 VC4- carbias 1k
R150 V9+ carbias 7.5k
R151 carbias 0 2.2k
C65 carbias 0 100n
C66 0 VC4- 100n
R152 VC4+ carbias 1k
C67 N026 VC4+ 10n
R153 sine38k N026 220k
R119 N003 N002 100k
R120 N004 N003 100k
R121 N003 N006 100k
X§TL10 0 N003 V9+ V9- N004 TL072  ; pins In+ In- V+ V- OUT
R122 N008 N004 100K
R123 D_Out N008 100k
X§TL11 0 N008 V9+ V9- D_Out TL072  ; pins In+ In- V+ V- OUT
X§U27 N050 N036 V9+ V9- N036 NE5532  ; pins 1 2 3 4 5
X§U28 N051 N040 V9+ V9- N040 NE5532  ; pins 1 2 3 4 5
X§U31 N052 N042 V9+ V9- N042 NE5532  ; pins 1 2 3 4 5
X§U32 N053 N044 V9+ V9- N044 NE5532  ; pins 1 2 3 4 5
R138 N050 N035 51k
R139 N035 stereo_unfiltered 22k
R154 N051 N039 51k
R163 N039 N036 30k
R155 N052 N041 75k
R156 N041 N040 43k
R157 N043 N042 68k
R158 N053 N043 130k
C55 N050 0 680p
C56 N051 0 270p
C60 N052 0 56p
C61 N053 0 10p
C62 N036 N035 1n
C68 N040 N039 1n
C69 N042 N041 1n
C70 N044 N043 1.8n
C71 stereo_filtered N044 10µ
R159 stereo_filtered 0 100k
R124 N023 N002 100K
R125 N024 N023 100k
R128 N033 N006 100k
R134 0 N033 100k
X§TL12 N033 N023 V9+ V9- N024 TL072  ; pins In+ In- V+ V- OUT
R135 N027 N024 10k
R136 G_out N027 10k
X§TL13 0 N027 V9+ V9- G_out TL072  ; pins In+ In- V+ V- OUT
X§TL14 MonoTest N001 V9+ V9- N002 TL072  ; pins In+ In- V+ V- OUT
R137 N002 N001 6.8k
R160 N001 0 10k
X§TL15 stereo_filtered N032 V9+ V9- N006 TL072  ; pins In+ In- V+ V- OUT
R161 N006 N032 47k
R162 N032 0 10k
R201 N046 mpx_buf 2.7k
R202 N046 0 9.1k
C201 N047 N046 1n
X§U33 0 N047 V9+ V9- N034 TL072  ; pins In+ In- V+ V- OUT
R203 N034 N047 33k
C202 N034 N046 1n
R204 N048 N034 5.1k
C203 N048 0 1n
C208 N049 N048 100n
X§U35 N049 f19 pd vc f76 V9+ 0 CD4046 fmin=60k fmax=95k  ; pins SIGIN COMPIN PC1out VCOin VCOout VDD VSS
X§U36 f76 sine38k f38 sine38k f38 f19b f19 f19b V9+ 0 CD4013  ; pins CLK1 D1 Q1 ~Q1 CLK2 D2 Q2 ~Q2 VDD VSS
R208 N037 pd 100k
X§U34 vref N037 V9+ V9- N038 TL072  ; pins In+ In- V+ V- OUT
R209 N045 N037 24k
C206 N038 N045 47n
R211 N038 N037 10Meg
R210 vc N038 10k
C207 vc 0 15n
R206 V9+ vref 10k
R207 vref 0 10k
C205 vref 0 100n
R164 OUT 0 100k
* Buffer to demodulator (stereo bandpass removed)
* LowPass Filter Mono
* AM demodulation
* G and D signal recovery circuit
* Inputs recorded from the encoder run
* (car_ref = encoder carrier, used only for comparison)
.tran 0 20m 10m 1u
.four 38057.5 1 50 V(sine38k) V(car_ref)
.lib tl072.cir
.lib mc1496.lib
.lib NE5532.sub
.four 994.5 6 9 V(MonoTest) V(stereo_filtered) V(G_out) V(D_out)
* 38 kHz CARRIER REGENERATOR: PLL locked to the 19 kHz pilot (see page 6 of the PDF)
* Pilot bandpass 19.04 kHz, gain 6, Q 2
* Phase trim (PCB: 3.3k + 5k trimmer)
* VCO 60 to 95 kHz. Real chip: C1 = 1n C0G, R1 = 27k, R2 = 10k + 10k trimmer (trim until VCOin = 4.5 V)
* Divide by 4: f38 = 38 kHz, f19 = 19 kHz to COMPIN
* Carrier sine38k = ~Q1 (pin 2) goes to R153 220k
* PI loop filter, about 200 Hz loop bandwidth
.lib CD4046.sub
.lib CD4013.sub
* 0
* 1
* 2
* 3
* Stereo Bandpass Filter
* 4
* 5
.lib NE5532.sub
.lib mc1496.lib
.backanno
.end